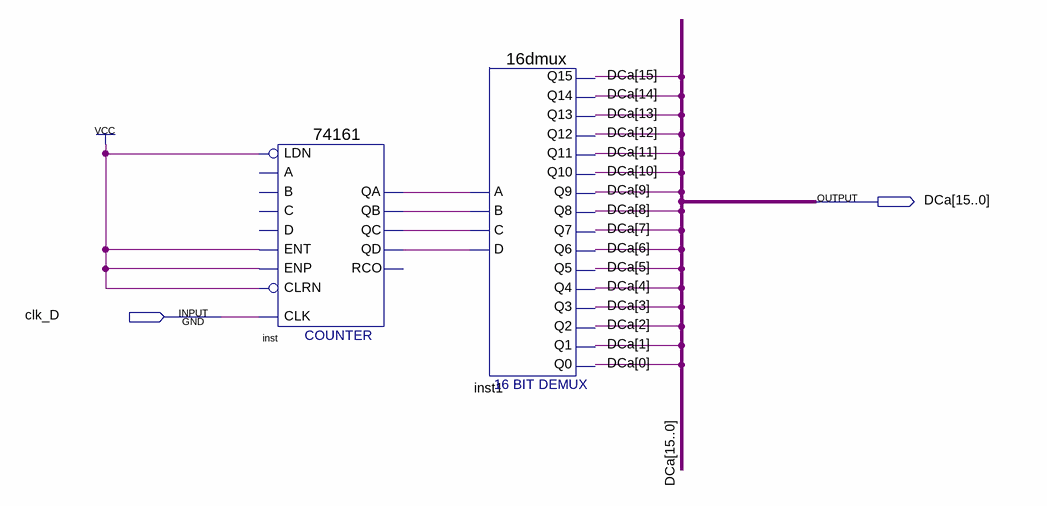
[diagram p0: schematic sheet]
// Quartus schematic Block3.bdf as structural Verilog: 2 symbols, 2 pins
module Block3 (
  input  clk_D,
  output [15:0] DCa
);

  wire inst_qa, inst_qb, inst_qc, inst_qd;

  \74161  inst (
    .CLRN(1'b1), .CLK(clk_D), .ENP(1'b1), .LDN(1'b1), .ENT(1'b1), .QD(inst_qd), .QC(inst_qc), .QB(inst_qb),
    .QA(inst_qa));  // open: A, D, B, C, RCO
  \16dmux  inst1 (
    .C(inst_qc), .B(inst_qb), .A(inst_qa), .D(inst_qd), .Q12(DCa[12]), .Q13(DCa[13]), .Q11(DCa[11]),
    .Q9(DCa[9]), .Q10(DCa[10]), .Q7(DCa[7]), .Q8(DCa[8]), .Q4(DCa[4]), .Q5(DCa[5]), .Q6(DCa[6]), .Q2(DCa[2]),
    .Q3(DCa[3]), .Q14(DCa[14]), .Q15(DCa[15]), .Q0(DCa[0]), .Q1(DCa[1]));
endmodule
